# Altium schematic sheet CORE-328PB.SchDoc
size A3; SheetNumber: 1; SheetTotal: 1
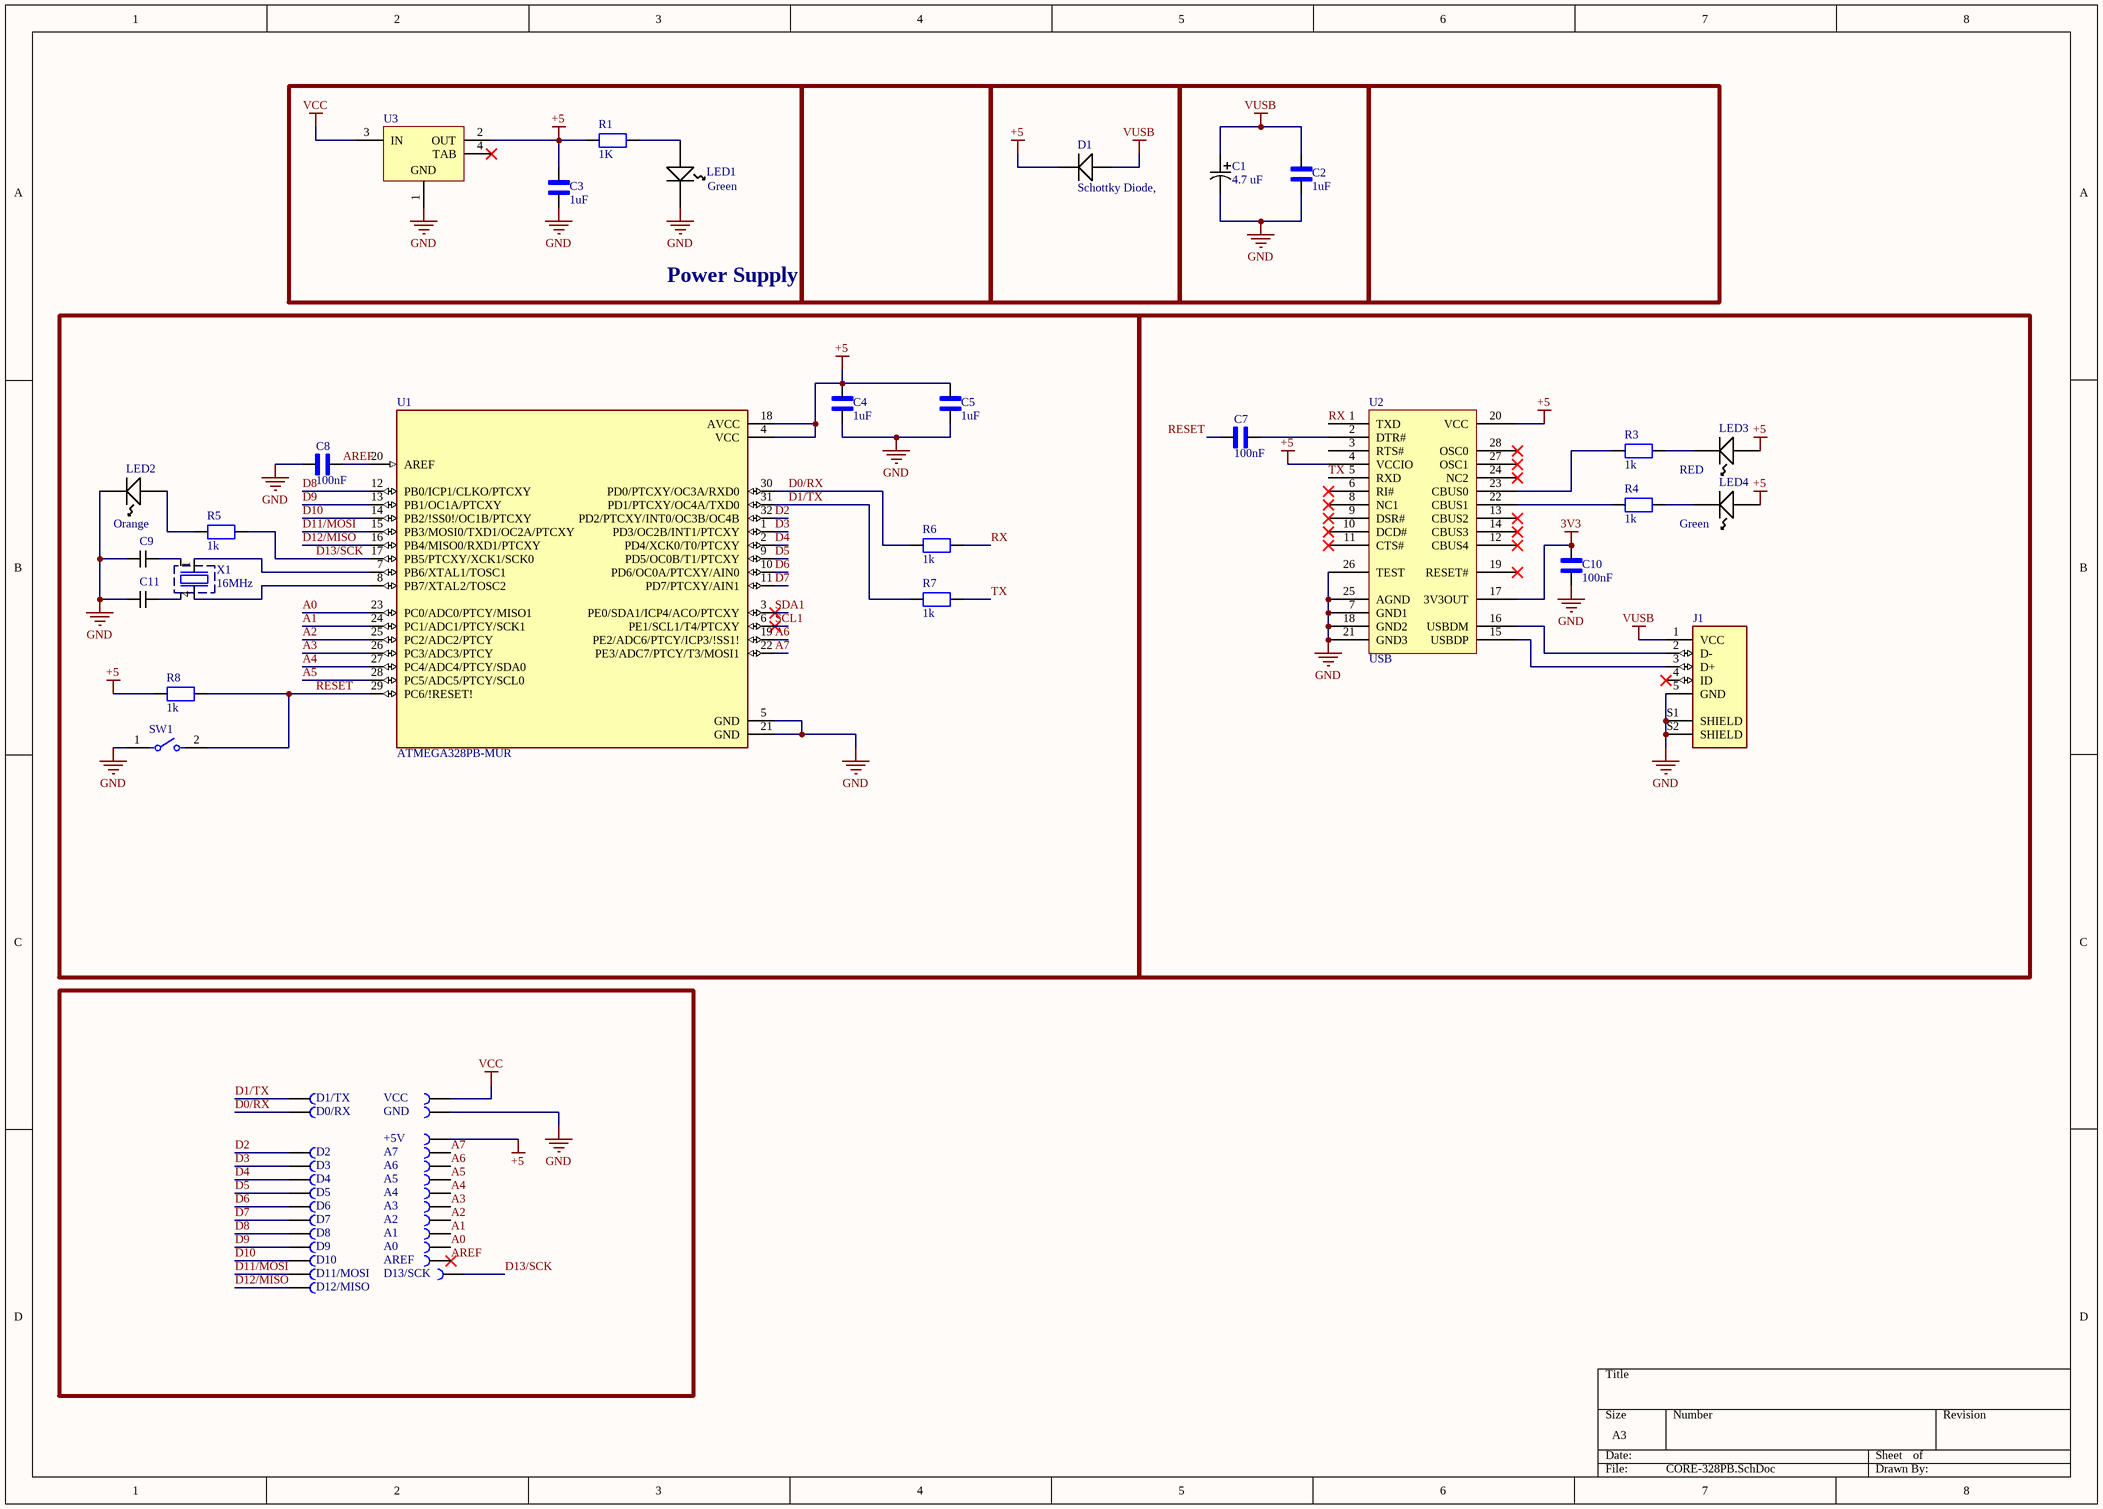
[diagram p0: CORE-328PB.SchDoc]

## Parts
+5V  Castellated Pad  [PCBComponent_1]  (value not drawn)
A0  Castellated Pad  [PCBComponent_1]  (value not drawn)
A1  Castellated Pad  [PCBComponent_1]  (value not drawn)
A2  Castellated Pad  [PCBComponent_1]  (value not drawn)
A3  Castellated Pad  [PCBComponent_1]  (value not drawn)
A4  Castellated Pad  [PCBComponent_1]  (value not drawn)
A5  Castellated Pad  [PCBComponent_1]  (value not drawn)
A6  Castellated Pad  [PCBComponent_1]  (value not drawn)
A7  Castellated Pad  [PCBComponent_1]  (value not drawn)
AREF  Castellated Pad  [PCBComponent_1]  (value not drawn)
C1  4.7 uF  [CAPMP7.6X4.3_3.1N_KEM]
C2  1uF  [CAPC1608X90]
C3  1uF  [CAPC1608X90]
C4  1uF  [CAPC1608X90]
C5  1uF  [CAPC1608X90]
C7  100nF  [CAPC1608X90]
C8  100nF  [CAPC1608X90]
C9  C0805C180J5GACTU  [CAPCP2012X09N]  (value not drawn)
C10  100nF  [CAPC1608X90]
C11  C0805C180J5GACTU  [CAPCP2012X09N]  (value not drawn)
D0/RX  Castellated Pad  [PCBComponent_1]  (value not drawn)
D1  Schottky Diode,  [DIOM1712X07N]
D1/TX  Castellated Pad  [PCBComponent_1]  (value not drawn)
D2  Castellated Pad  [PCBComponent_1]  (value not drawn)
D3  Castellated Pad  [PCBComponent_1]  (value not drawn)
D4  Castellated Pad  [PCBComponent_1]  (value not drawn)
D5  Castellated Pad  [PCBComponent_1]  (value not drawn)
D6  Castellated Pad  [PCBComponent_1]  (value not drawn)
D7  Castellated Pad  [PCBComponent_1]  (value not drawn)
D8  Castellated Pad  [PCBComponent_1]  (value not drawn)
D9  Castellated Pad  [PCBComponent_1]  (value not drawn)
D10  Castellated Pad  [PCBComponent_1]  (value not drawn)
D11/MOSI  Castellated Pad  [PCBComponent_1]  (value not drawn)
D12/MISO  Castellated Pad  [PCBComponent_1]  (value not drawn)
D13/SCK  Castellated Pad  [PCBComponent_1]  (value not drawn)
GND  Castellated Pad  [PCBComponent_1]  (value not drawn)
J1  USB3131-30-0230-A_REVB  [GCT_USB3131-30-0230-A_REVB]  (value not drawn)
LED1  Color: Green  [LED1913X12NGREEN]  (hidden comment: Green LED)
LED2  Color: Orange  [LED1913X12NYEL/ORANGE]  (hidden comment: Kingbright Orange LED, 200 mcd 120 ° 0805)
LED3  Color: RED  [LED1913X12NRED]  (hidden comment: Kingbright Red LED, 100 mcd 120 ° 0805)
LED4  Color: Green  [LED1913X12NGREEN]  (hidden comment: Kingbright Green LED, 70 mcd 120 ° 0805)
R1  1K  [RESC1608X55N]
R3  1k  [RESC1608X55N]
R4  1k  [RESC1608X55N]
R5  1k  [RESC1608X55N]
R6  1k  [RESC1608X55N]
R7  1k  [RESC1608X55N]
R8  1k  [RESC1608X55N]
SW1  PTS635SK25SM  [FP-PTS635SK25SM-MFG]  (value not drawn)
U1  ATMEGA328PB-MUR  [QFN50P500X500X90-33N]
U2  USB  [SOP65P780X200-28N]
U3  LM1117IMPX-5.0  [DCY0004A_M]  (value not drawn)
VCC  Castellated Pad  [PCBComponent_1]  (value not drawn)
X1  value 16MHz  [Aker S5C Crystal]  (hidden comment: Aker 16MHz Crystal SMT)

## Blocks framed on the sheet
Power Supply: C3 LED1 R1 U3

## Nets
3V3: C10.1 U2.17(3V3OUT)
+5: +5V.0(Pad) C3.1 C4.1 C5.1 D1.1 LED3.1(A) LED4.1(A) R1.1 R8.1 U1.4(VCC) U1.18(AVCC) U2.4(VCCIO) U2.20(VCC) U3.2(OUT)
GND: C1.2 C2.2 C3.2 C4.2 C5.2 C8.1 C9.1 C10.2 C11.1 GND.0(Pad) J1.5(GND) J1.S1(SHIELD) J1.S2(SHIELD) LED1.2(K) LED2.2(K) SW1.1 U1.5(GND) U1.21(GND) U2.7(GND1) U2.18(GND2) U2.21(GND3) U2.25(AGND) U2.26(TEST) U3.1(GND)
VCC: U3.3(IN) VCC.0(Pad)
VUSB: C1.1 C2.1 D1.2 J1.1(VCC)
A0: A0.0(Pad) U1.23(PC0/ADC0/PTCY/MISO1)
A1: A1.0(Pad) U1.24(PC1/ADC1/PTCY/SCK1)
A2: A2.0(Pad) U1.25(PC2/ADC2/PTCY)
A3: A3.0(Pad) U1.26(PC3/ADC3/PTCY)
A4: A4.0(Pad) U1.27(PC4/ADC4/PTCY/SDA0)
A5: A5.0(Pad) U1.28(PC5/ADC5/PTCY/SCL0)
A6: A6.0(Pad) U1.19(PE2/ADC6/PTCY/ICP3/!SS1!)
A7: A7.0(Pad) U1.22(PE3/ADC7/PTCY/T3/MOSI1)
AREF: AREF.0(Pad) C8.2 U1.20(AREF)
D0/RX: D0/RX.0(Pad) R6.1 U1.30(PD0/PTCXY/OC3A/RXD0)
D1/TX: D1/TX.0(Pad) R7.1 U1.31(PD1/PTCXY/OC4A/TXD0)
D2: D2.0(Pad) U1.32(PD2/PTCXY/INT0/OC3B/OC4B)
D3: D3.0(Pad) U1.1(PD3/OC2B/INT1/PTCXY)
D4: D4.0(Pad) U1.2(PD4/XCK0/T0/PTCXY)
D5: D5.0(Pad) U1.9(PD5/OC0B/T1/PTCXY)
D6: D6.0(Pad) U1.10(PD6/OC0A/PTCXY/AIN0)
D7: D7.0(Pad) U1.11(PD7/PTCXY/AIN1)
D8: D8.0(Pad) U1.12(PB0/ICP1/CLKO/PTCXY)
D9: D9.0(Pad) U1.13(PB1/OC1A/PTCXY)
D10: D10.0(Pad) U1.14(PB2/!SS0!/OC1B/PTCXY)
D11/MOSI: D11/MOSI.0(Pad) U1.15(PB3/MOSI0/TXD1/OC2A/PTCXY)
D12/MISO: D12/MISO.0(Pad) U1.16(PB4/MISO0/RXD1/PTCXY)
D13/SCK: D13/SCK.0(Pad) R5.2 U1.17(PB5/PTCXY/XCK1/SCK0)
RESET: C7.1 R8.2 SW1.2 U1.29(PC6/!RESET!)
RX: R6.2 U2.1(TXD)
SCL1: U1.6(PE1/SCL1/T4/PTCXY)
SDA1: U1.3(PE0/SDA1/ICP4/ACO/PTCXY)
TX: R7.2 U2.5(RXD)
NetC7_2: C7.2 U2.2(DTR#)
NetC9_2: C9.2 X1.3(Gnd)
NetC11_2: C11.2 X1.2(Gnd)
NetJ1_2: J1.2(D-) U2.16(USBDM)
NetJ1_3: J1.3(D+) U2.15(USBDP)
NetLED1_1: LED1.1(A) R1.2
NetLED2_1: LED2.1(A) R5.1
NetLED3_2: LED3.2(K) R3.2
NetLED4_2: LED4.2(K) R4.2
NetR3_1: R3.1 U2.23(CBUS0)
NetR4_1: R4.1 U2.22(CBUS1)
NetU1_7: U1.7(PB6/XTAL1/TOSC1) X1.1
NetU1_8: U1.8(PB7/XTAL2/TOSC2) X1.4

Not connected (* = marked no-connect by the designer): J1 4(ID)*; U2 3(RTS#) 6(RI#)* 8(NC1)* 9(DSR#)* 10(DCD#)* 11(CTS#)* 12(CBUS4)* 13(CBUS2)* 14(CBUS3)* 19(RESET#)* 24(NC2)* 27(OSC1)* 28(OSC0)*; U3 4(TAB)*

## Library data of the parts
+5V A0-A7 AREF D0/RX D1/TX D2-D10 D11/MOSI D12/MISO D13/SCK GND VCC = Castellated Pad: Custom_Castellated_Module
C1 = T521D475M063ATE075: T521, Tantalum, Polymer Tantalum, Commercial Grade, 4.7 uF, 20%, 63 VDC, SMD, Polymer, Molded, Low ESR, Non-Combustible, 75 mOhms, 7343, Height Max = 3.1mm; Manufacturer_Name: Kemet; Copyright: Copyright (C) 2026 Ultra Librarian. All rights reserved.; Manufacturer_Part_Number: T521D475M063ATE075; Datasheet: https://content.kemet.com/datasheets/KEM_T2076_T52X-530.pdf
C2-C5 C7 C8 C10 = CC0603MRX5R8BB105: 1 ÂµF Â±20% 25V Ceramic Capacitor X5R 0603 (1608 Metric); MF: Yageo; SnapEDA_Link: https://www.snapeda.com/parts/CC0603MRX5R8BB105/Yageo/view-part/?ref=snap; Package: 0603 Yageo; Value: *; MP: CC0603MRX5R8BB105; Check_prices: https://www.snapeda.com/parts/CC0603MRX5R8BB105/Yageo/view-part/?ref=eda
C9 C11 = 18pF Ceramic Multilayer Capacitor, 50 V dc C0G Dielectric ±5% SMD: Manufacturer: Kemet; Voltage: 50V; Creator: Ritesh Kanjee; Date Created: 18 February 2015; Package: 0805; RS Stock No.: 648-0935; Datasheet URL: http://za.rs-online.com/web/p/ceramic-multilayer-capacitors/6480935/?searchTerm=C0805C180J5GACTU&relevancy-data=636F3D3226696E3D4931384E4B6E6F776E41734D504E266C753D656E266D6D3D6D61746368616C6C7061727469616C26706D3D5E5B5C707B4C7D5C707B4E647D2D2C2F255C2E5D2B2426706F3D313326736E3D592673743D4D414E5F504152545F4E554D4245522677633D424F5448267573743D4330383035433138304A35474143545526; Capacitance: 18pF
D1 = Schottky Diode, 0.5A, 20V, 2.4ns, 2-Pin SMini2 F5 B: Panasonic DB2J20900L Schottky Diode, 0.5A, 20V, 2.4ns, 2-Pin SMini2 F5 B; Created By: R Kanjee; Date Created: 1 March 2015; Manufacturer: Panasonic; RS Stock No.: 713-2703; Manufacturer Part No.: DB2J20900L; Datasheet: http://docs-europe.electrocomponents.com/webdocs/1398/0900766b813986b3.pdf; Maximum Continuous Forward Current: 0.5A; Peak Reverse Repetitive Voltage: 20V
J1 = USB3131-30-0230-A_REVB: USB - micro B USB 2.0 Receptacle Connector 5 Position Through Hole; Availability: Unavailable; MP: USB3131-30-0230-A_REVB; Value: *; Package: None; Price: None
LED1 LED4 = Kingbright Green LED, 70 mcd 120 ° 0805: Manufacturer Part No.: KP-2012MGC; Forward Voltage: 2.1 V; Creator: Ritesh Kanjee; Date Created: 18 February 2015; Manufacturer: KingBright; RS Stock No.: 466-3778; Datasheet URL: http://za.rs-online.com/web/p/visible-leds/4663778/
LED2 = Kingbright Orange LED, 200 mcd 120 ° 0805: Manufacturer Part No.: KP-2012SEC; Forward Voltage: 1.85V; Creator: Ritesh Kanjee; Date Created: 18 February 2015; Manufacturer: KingBright; RS Stock No.: 466-3790; Datasheet URL: http://za.rs-online.com/web/p/visible-leds/4663790/
LED3 = Kingbright Red LED, 100 mcd 120 ° 0805: Manufacturer Part No.: KP-2012SRC-PRV; Forward Voltage: 1.85V; Creator: Ritesh Kanjee; Date Created: 18 February 2015; Manufacturer: KingBright; RS Stock No.: 466-3813; Datasheet URL: http://za.rs-online.com/web/p/visible-leds/4663813/
R1 R3-R8 = CR0603AFX-1001EAS: DirenÃ§, AS 0603 1k %1 100mW TC100 ¦ Bourns CR0603AFX-1001EAS; SnapEDA_Link: https://www.snapeda.com/parts/CR0603AFX-1001EAS/Bourns/view-part/?ref=snap; Package: 0603-2 Bourns; Value: *; MF: Bourns; MP: CR0603AFX-1001EAS; Check_prices: https://www.snapeda.com/parts/CR0603AFX-1001EAS/Bourns/view-part/?ref=eda
SW1 = CMP-10040-000010-1: SWITCH TACTILE SPST-NO 0.05A 12V; Manufacturer: C&K Components; Operating Force: 260gf; Contact Current Rating: 50mA; Contact Resistance: 100mΩ; Throw Configuration: SPST; Electromechanical Life: 20000Cycles; Category: Switch; Digikey Description: SWITCH TACTILE SPST-NO 0.05A 12V; Temperature: -10°C to +60°C; Voltage Rating Dc: 12V; Lead Free: Yes; Temperature Range High: +60°C; ComponentLink2Description: Datasheet; Device Class L3: Tactile Switches; Octopart: https://octopart.com/pts635sk25sm-c%26k+components-8206497; Automotive: No; Height: 2.5mm; Temperature Range Low: -10°C; Mount: Surface Mount; RoHS: TRUE; Device Class L2: Switches; Package: PTS635SK25SM; Device Class L1: Electromechanical; Manufacturer Part Number: PTS635SK25SM; ComponentLink2URL: https://media.digikey.com/pdf/Data%20Sheets/C&K/PTS635%20with%2025%20code%20actuator.pdf
U1 = ATMEGA328PB-MUR: AVR series Microcontroller IC 8-Bit 20MHz 32KB (16K x 16) FLASH 32-VFQFN (5x5); MF: Microchip Technology; Purchase-URL: https://pricing.snapeda.com/search/part/ATMEGA328PB-MUR/?ref=eda; Value: *; Package: VFQFN-32 Microchip Technology; Check_prices: https://www.snapeda.com/parts/ATMEGA328PB-MUR/Microchip/view-part/?ref=eda; Price: None; Availability: In Stock; MP: ATMEGA328PB-MUR; SnapEDA_Link: https://www.snapeda.com/parts/ATMEGA328PB-MUR/Microchip/view-part/?ref=snap
U2 = FT232RL USB to UART, Universal Asynchronous Receiver & Transmitter 3MBd, 28-Pin, SSOP: FT232RL, Universal Asynchronous Receiver & Transmitter 3MBd, 28-Pin, SSOP; Manufacturer: FTDI Chip; Creator: R Kanjee; Date Created: 03 March 2015; Manufacturer Part No.: FT232RL; RS Stock No.: 406-580; Pin Count: 28
U3 = CMP-0062-01626-4: 800mA Low-Dropout Linear Regulator, 4-pin SOT-223; Manufacturer: Texas Instruments; PowerWise: N; CompType: LDO IC; High-Reliability: Y; PackageTopMarking: XYTT*N06B; ComponentLink1URL: http://www.ti.com/general/docs/lit/getliterature.tsp?genericPartNumber=LM1117-N&fileType=pdf; RoHS: N; PackageDescription: Molded SOT-223, 6.50 x 3.56 x 1.6mm Body, 4 Lead, 2.3mm Pitch; Code_JEDEC: TO-261-AA; ComponentLink1Description: Datasheet URL; PinCount: 4; PackageReference: DCY0004A; Code_IPC: SOT223-4; PartNumber: LM1117IMPX-5.0
X1 = Aker  C5S-16.000-12-3030-X: Aker S5C SMT Crystal; Load Capacitance: 12pF; Frequency Stability: +/-30ppm; RS: RS 671-9488; Creator: R Kanjee; Manufacturer: Aker; Manufacturer Part #: C5S-16.000-12-3030-X; Supplier: RS; RS Stock Nr.: 671-9488; HelpURL: http://za.rs-online.com/web/p/crystal-units/6719488/; Package: 3.2x5mm SMD